# Altium schematic sheet Connector-Sheet.SchDoc
size 420 x 297 mm; SheetNumber: 8; SheetTotal: 11
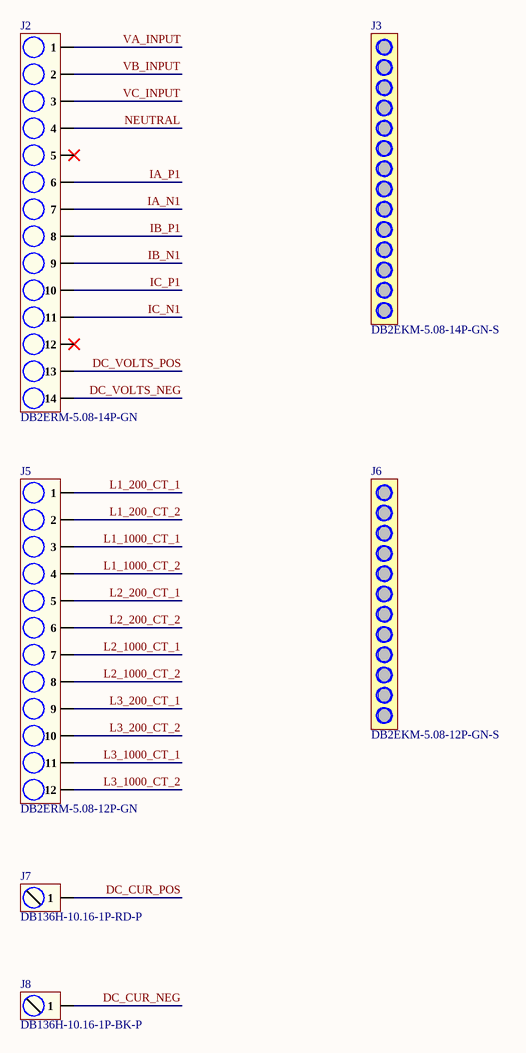
[diagram p0: Connector-Sheet.SchDoc]

## Parts
J2  DB2ERM-5.08-14P-GN  [DB2ERM-5.08-14P-GN]
J3  DB2EKM-5.08-14P-GN-S  (mechanical)
J5  DB2ERM-5.08-12P-GN  [DB2ERM-5.08-12P-GN]
J6  DB2EKM-5.08-12P-GN-S  (mechanical)
J7  DB136H-10.16-1P-RD-P  [DB136H-10.16-1P-RD-P]
J8  DB136H-10.16-1P-BK-P  [DB136H-10.16-1P-BK-P]

## Nets
DC_CUR_NEG: J8.1
DC_CUR_POS: J7.1
DC_VOLTS_NEG: J2.14
DC_VOLTS_POS: J2.13
IA_N1: J2.7
IA_P1: J2.6
IB_N1: J2.9
IB_P1: J2.8
IC_N1: J2.11
IC_P1: J2.10
L1_200_CT_1: J5.1
L1_200_CT_2: J5.2
L1_1000_CT_1: J5.3
L1_1000_CT_2: J5.4
L2_200_CT_1: J5.5
L2_200_CT_2: J5.6
L2_1000_CT_1: J5.7
L2_1000_CT_2: J5.8
L3_200_CT_1: J5.9
L3_200_CT_2: J5.10
L3_1000_CT_1: J5.11
L3_1000_CT_2: J5.12
NEUTRAL: J2.4
VA_INPUT: J2.1
VB_INPUT: J2.2
VC_INPUT: J2.3

Not connected (* = marked no-connect by the designer): J2 5* 12*

## Notes on the sheet
- ZyntelliTech
- File:
- Title:
- Date:
- Page
- Num:
- Total:
- Drawn By: Huzaifa Ali

## Library data of the parts
J2 = DB2ERM-5.08-14P-GN: 320V 20A 14 Bend -40℃~+105℃ 1 5.08mm 1x14P Green Receptacle-Close Screw Fixing Push-Pull,P=5.08mm Pluggable System Terminal Block ROHS; Manufacturer: DORABO; Manufacturer Part Number: DB2ERM-5.08-14P-GN; Package: Push-Pull,P=5.08mm; LCSC Part Number: C430534; Item Type: Terminal Block; ComponentLink1Description: LCSC; ComponentLink1URL: https://www.lcsc.com/product-detail/Pluggable-System-Terminal-Block_DORABO-DB2ERM-5-08-14P-GN_C430534.html?s_z=n_DB2ERM-5.08-14P-GN
J3 = DB2EKM-5.08-14P-GN-S: -40℃~+105℃ 2.5 1 14~28 5.08mm 320V 20A 14 1x14P Green Plug Screw Fixing P=5.08mm Pluggable System Terminal Block ROHS; Manufacturer: DORABO; Manufacturer Part Number: DB2EKM-5.08-14P-GN-S; Package: P=5.08mm; LCSC Part Number: C430521; Item Type: Terminal Block; ComponentLink1Description: LCSC; ComponentLink1URL: https://www.lcsc.com/product-detail/Pluggable-System-Terminal-Block_DORABO-DB2EKM-5-08-14P-GN-S_C430521.html?s_z=n_DB2EKM-5.08-14P-GN-S
J5 = DB2ERM-5.08-12P-GN: 320V 20A 12 Bend -40℃~+105℃ 1 5.08mm 1x12P Green Receptacle-Close Screw Fixing Push-Pull,P=5.08mm Pluggable System Terminal Block ROHS; Manufacturer: DORABO; Manufacturer Part Number: DB2ERM-5.08-12P-GN; Package: Push-Pull,P=5.08mm; LCSC Part Number: C395827; Item Type: Terminal Block; ComponentLink1Description: LCSC; ComponentLink1URL: https://www.lcsc.com/product-detail/Pluggable-System-Terminal-Block_DORABO-DB2ERM-5-08-12P-GN_C395827.html?s_z=n_DB2ERM-5.08-12P-GN
J6 = DB2EKM-5.08-12P-GN-S: -40℃~+105℃ 2.5 1 14~28 5.08mm 320V 20A 12 1x12P Green Plug Screw Fixing P=5.08mm Pluggable System Terminal Block ROHS; Manufacturer: DORABO; Manufacturer Part Number: DB2EKM-5.08-12P-GN-S; Package: P=5.08mm; LCSC Part Number: C395826; Item Type: Terminal Block; ComponentLink1Description: LCSC; ComponentLink1URL: https://www.lcsc.com/product-detail/Pluggable-System-Terminal-Block_DORABO-DB2EKM-5-08-12P-GN-S_C395826.html?s_z=n_DB2EKM-5.08-12P-GN-S
J7 = DB136H-10.16-1P-RD-P: 1000V 57A 1 1 10.16mm P=10.16mm Pluggable System Terminal Block ROHS; Manufacturer: DORABO; Manufacturer Part Number: DB136H-10.16-1P-RD-P; Package: P=10.16mm; LCSC Part Number: C5445315; Item Type: Terminal Block; ComponentLink1Description: LCSC; ComponentLink1URL: https://www.lcsc.com/product-detail/Pluggable-System-Terminal-Block_DORABO-DB136H-10-16-1P-RD-P_C5445315.html
J8 = DB136H-10.16-1P-BK-P: 1000V 57A 1 1 10.16mm P=10.16mm Pluggable System Terminal Block ROHS; Manufacturer: DORABO; Manufacturer Part Number: DB136H-10.16-1P-BK-P; Package: P=10.16mm; LCSC Part Number: C5445314; Item Type: Terminal Block; ComponentLink1Description: LCSC; ComponentLink1URL: https://www.lcsc.com/product-detail/Pluggable-System-Terminal-Block_DORABO-DB136H-10-16-1P-BK-P_C5445314.html